# Altium schematic sheet signal-light-3.SchDoc
size A4; SheetNumber: 6; SheetTotal: 21
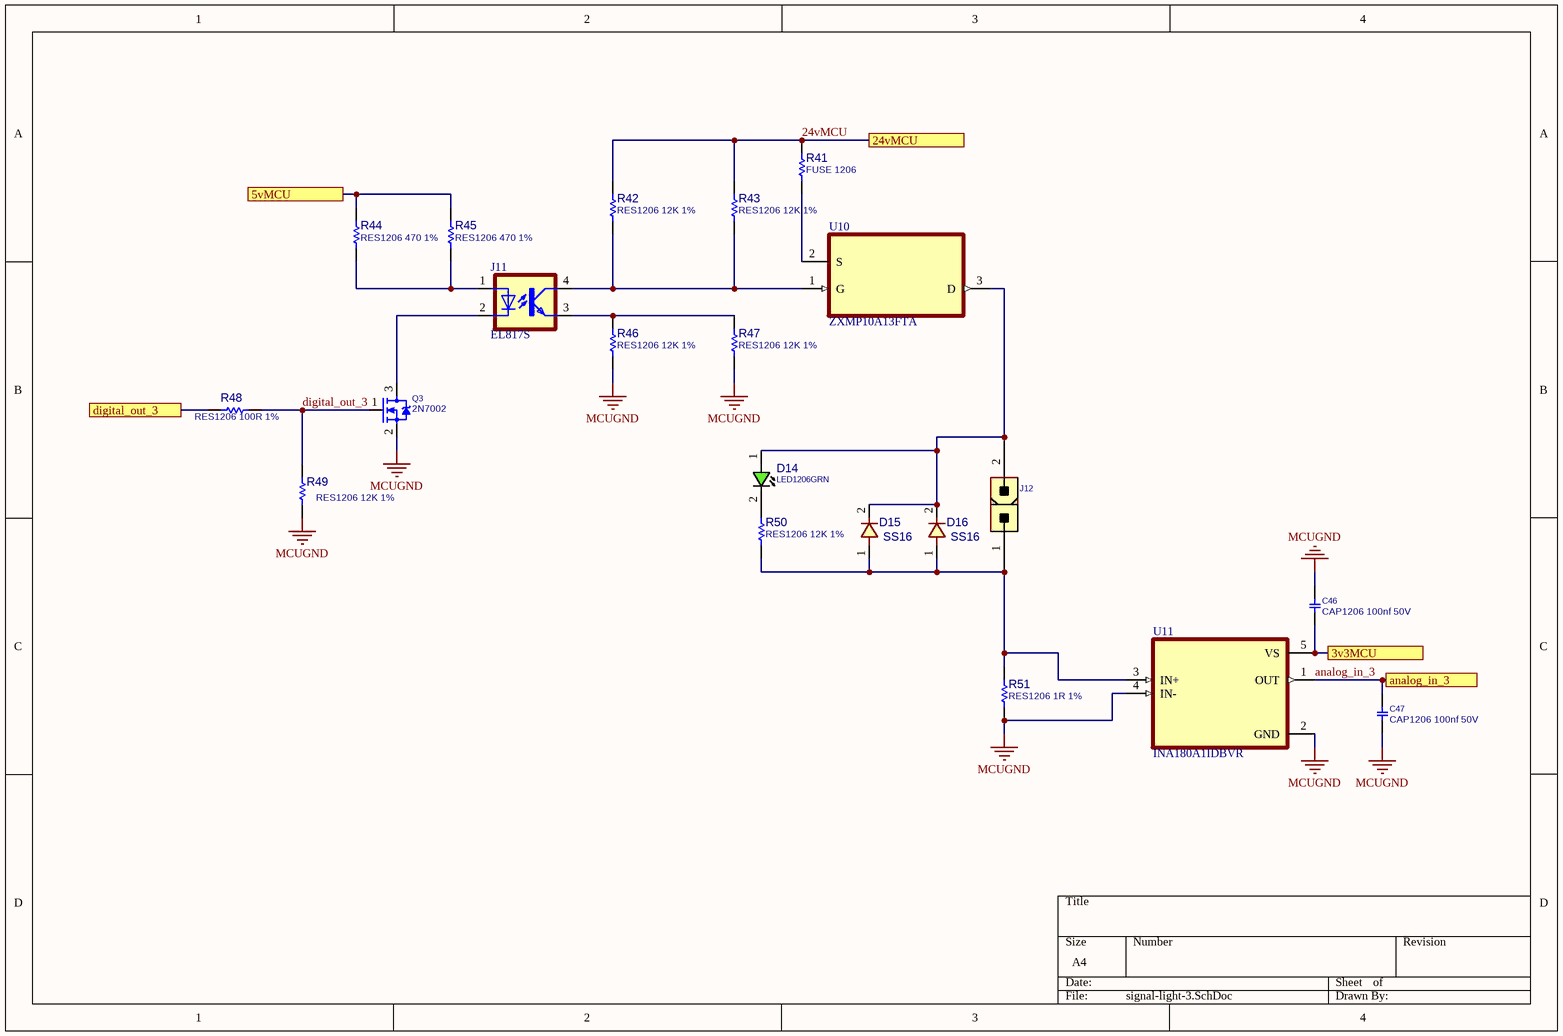
[diagram p0: signal-light-3.SchDoc]

## Parts
C46  CAP1206 100nf 50V  [C1206]
C47  CAP1206 100nf 50V  [C1206]
D14  LED1206GRN  [LED1206GRN]
D15  SS16  [D_SMA]
D16  SS16  [D_SMA]
J11  EL817S  [SOIC254P1030X460-4N]
J12  CONN_ATXPWR_2  [ATXPWR_2]  (value not drawn)
Q3  2N7002  [SOT23_3]
R41  FUSE 1206  [R1206]
R42  RES1206 12K 1%  [R1206]
R43  RES1206 12K 1%  [R1206]
R44  RES1206 470 1%  [R1206]
R45  RES1206 470 1%  [R1206]
R46  RES1206 12K 1%  [R1206]
R47  RES1206 12K 1%  [R1206]
R48  RES1206 100R 1%  [R1206]
R49  RES1206 12K 1%  [R1206]
R50  RES1206 12K 1%  [R1206]
R51  RES1206 1R 1%  [R1206]
U10  ZXMP10A13FTA  [SOT95P230X110-3N]
U11  INA180A1IDBVR  [SOT95P280X145-5N]

## Ports
3v3MCU, 5vMCU, 24vMCU, analog_in_3, digital_out_3

## Nets
MCUGND: C46.1 C47.2 Q3.2(SOURCE) R46.2 R47.2 R49.2 R51.2 U11.2(GND) U11.4(IN-)
3v3MCU: C46.2 U11.5(VS) ; port 3v3MCU
5vMCU: R44.2 R45.2 ; port 5vMCU
24vMCU: R41.1 R42.1 R43.1 ; port 24vMCU
analog_in_3: C47.1 U11.1(OUT) ; port analog_in_3
digital_out_3: Q3.1(GATE) R48.2 R49.1
digital_out_3: R48.1 ; port digital_out_3  [a separate net that carries the same name]
NetD14_1: D14.1(ANODE) D15.2 D16.2 J12.2 U10.3(D)
NetD14_2: D14.2(CATHODE) R50.1
NetD15_1: D15.1 D16.1 J12.1 R50.2 R51.1 U11.3(IN+)
NetJ11_1: J11.1(A) R44.1 R45.1
NetJ11_2: J11.2(C) Q3.3(DRAIN)
NetJ11_3: J11.3(EMIT) R46.1 R47.1
NetJ11_4: J11.4(COL) R42.2 R43.2 U10.1(G)
NetR41_2: R41.2 U10.2(S)

## Library data of the parts
C46 C47 = CAP_SMD_MLCC_1206: CAP, MLCC; PARAM: -, -%; MANF_P#: MANF_PART#; PARAM2: -V; PRICE: 100= 1$; MANF: -; ASSEMBLY: ASSEMBLY
D14 = LED_SMD_1206_GRN: LED, SMD, 1206, GREEN; PARAM: 20mA; DESC: DESCRIPTION; PARAM2: 2.2V; MANF: -; ASSEMBLY: ASSEMBLY; PRICE: 36t@Javan; MANF_P#: -; VALUE: LED1206GRN; MountType: SMT; PartType: LED
D15 D16 = DIODE_SMD_1N4001: DIODE, GENERAL PURPOSE, 50V/1A; DESC: DESCRIPTION; PARAM: 50V VRRM; PARAM2: 1A; MANF_P#: 1N4001; MANF: MANF; ASSEMBLY: ASSEMBLY; PRICE: PRICE; VALUE: SS16
J11 = EL817S: Optoisolator Transistor Output 5000Vrms 1 Channel 4-SMD; MF: Everlight Electronics; SnapEDA_Link: https://www.snapeda.com/parts/EL817S/Everlight+Electronics+Co+Ltd/view-part/?ref=snap; Package: SMD-4 Everlight Electronics Co Ltd; Value: *; MP: EL817S; Check_prices: https://www.snapeda.com/parts/EL817S/Everlight+Electronics+Co+Ltd/view-part/?ref=eda
J12 = CONN_ATXPWR_2: CONN, ATX POWER, 2 P; MANF: Molex; MANF_P#: 39281023; VALUE: CONN_ATXPWR_2; MountType: THD; PACKAGE: ATXPWR-2pin; Part Type: Conn.
Q3 = MOSN_2N7002_SOT23: MOSFET, N-CH, 60V, 0.3A; MANF: NXP; ASSEMBLY: ASSEMBLY; MANF_P#: 2N7002; PARAM2: 60v; PARAM: 0.3A; PRICE: 0.3t@Javan; VALUE: 2N7002
R41-R51 = RES_SMD_1206: RESISTOR, SMD; PARAM: 1%, 0.25W; DESC: DESCRIPTION; DIST#: MOUSER; MANF_P#: -; MANF: -; ASSEMBLY: ASSEMBLY; PRICE: -; PARAM2: -
U10 = ZXMP10A13FTA: P-Channel 100 V 600mA (Ta) 625mW (Ta) Surface Mount SOT-23-3; MF: Diodes Inc.; Purchase-URL: https://pricing.snapeda.com/search/part/ZXMP10A13FTA/?ref=eda; Package: SOT-23-3 Diodes Inc.; SnapEDA_Link: https://www.snapeda.com/parts/ZXMP10A13FTA/Diodes+Inc./view-part/?ref=snap; Availability: In Stock; Value: *; MP: ZXMP10A13FTA; Check_prices: https://www.snapeda.com/parts/ZXMP10A13FTA/Diodes+Inc./view-part/?ref=eda; Price: None
U11 = INA180A1IDBVR: 26V, 350kHz current sense amplifier; MF: Texas Instruments; SnapEDA_Link: https://www.snapeda.com/parts/INA180A1IDBVR/Texas+Instruments/view-part/?ref=snap; Package: SOT-23-5 Texas Instruments; Value: *; MP: INA180A1IDBVR; Check_prices: https://www.snapeda.com/parts/INA180A1IDBVR/Texas+Instruments/view-part/?ref=eda